# Altium schematic sheet Top_Sheet.SchDoc
size A4; DocumentNumber: 1; SheetNumber: 1; SheetTotal: 4
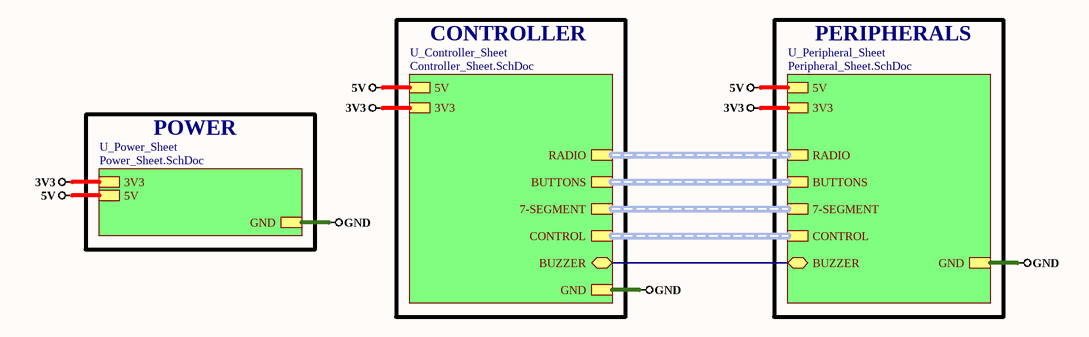
[diagram p0: Top_Sheet.SchDoc]

## Sub-sheets
U_Controller_Sheet = Controller_Sheet.SchDoc: GND, RADIO (harness RADIO), BUTTONS (harness BUTTONS), BUZZER (bidir), 7-SEGMENT (harness 7-SEGMENT), CONTROL (harness ENCODER), 5V, 3V3
U_Peripheral_Sheet = Peripheral_Sheet.SchDoc: RADIO (harness RADIO), 7-SEGMENT (harness 7-SEGMENT), BUTTONS (harness BUTTONS), BUZZER (bidir), 5V, GND, 3V3, CONTROL (harness ENCODER)
U_Power_Sheet = Power_Sheet.SchDoc: 5V, GND, 3V3

## Nets
3V3: sheet U_Controller_Sheet/3V3, sheet U_Peripheral_Sheet/3V3, sheet U_Power_Sheet/3V3
5V: sheet U_Controller_Sheet/5V, sheet U_Peripheral_Sheet/5V, sheet U_Power_Sheet/5V
GND: sheet U_Controller_Sheet/GND, sheet U_Peripheral_Sheet/GND, sheet U_Power_Sheet/GND
(unnamed): sheet U_Controller_Sheet/BUZZER, sheet U_Peripheral_Sheet/BUZZER

## Buses and harness runs
harness sheet U_Controller_Sheet/7-SEGMENT = sheet U_Peripheral_Sheet/7-SEGMENT
harness sheet U_Controller_Sheet/BUTTONS = sheet U_Peripheral_Sheet/BUTTONS
harness sheet U_Controller_Sheet/CONTROL = sheet U_Peripheral_Sheet/CONTROL
harness sheet U_Controller_Sheet/RADIO = sheet U_Peripheral_Sheet/RADIO

## Notes on the sheet
- CONTROLLER
- PERIPHERALS
- POWER
- File:
- Title:
- Date:
- Page
- Num:
- Total:
- Drawn By: Huzaifa Ali